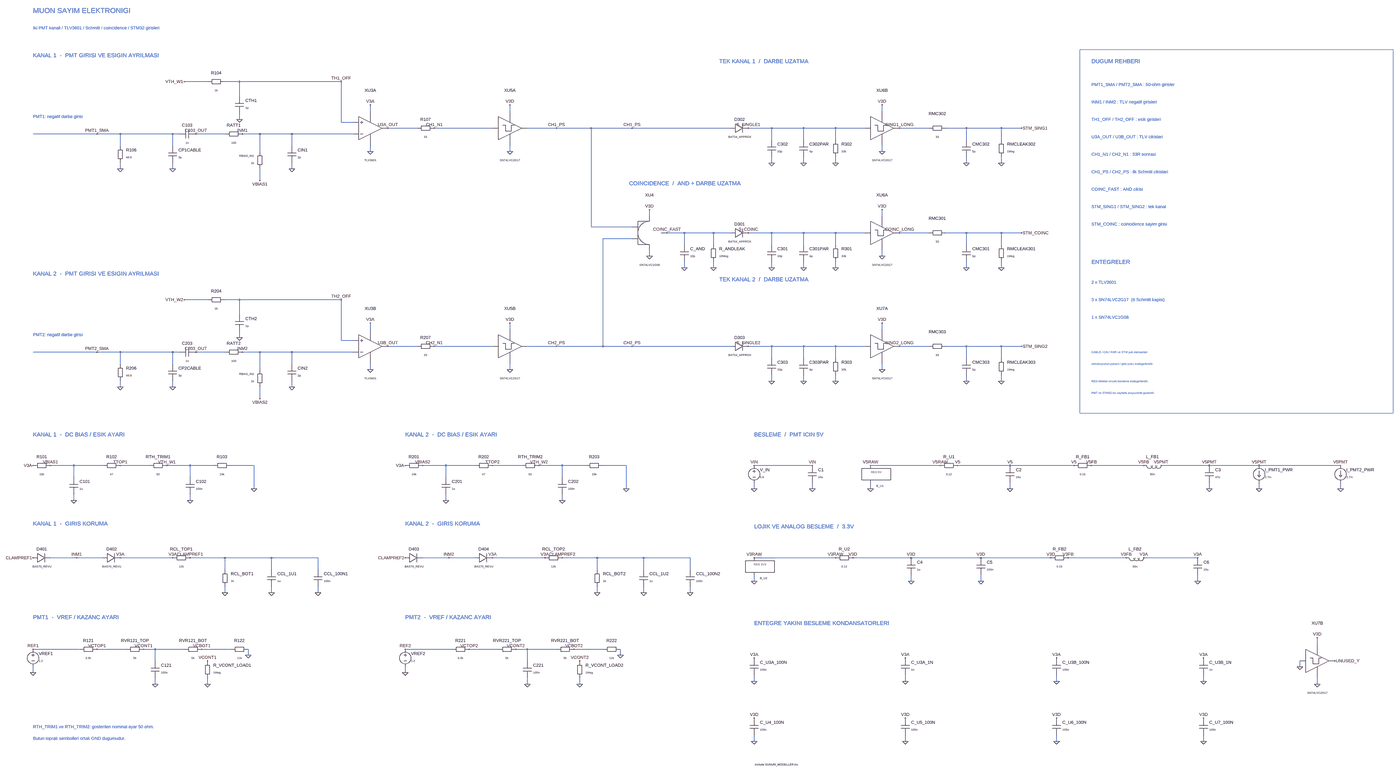
[diagram p0: schematic MUON_SUNUM.asc, whole sheet]
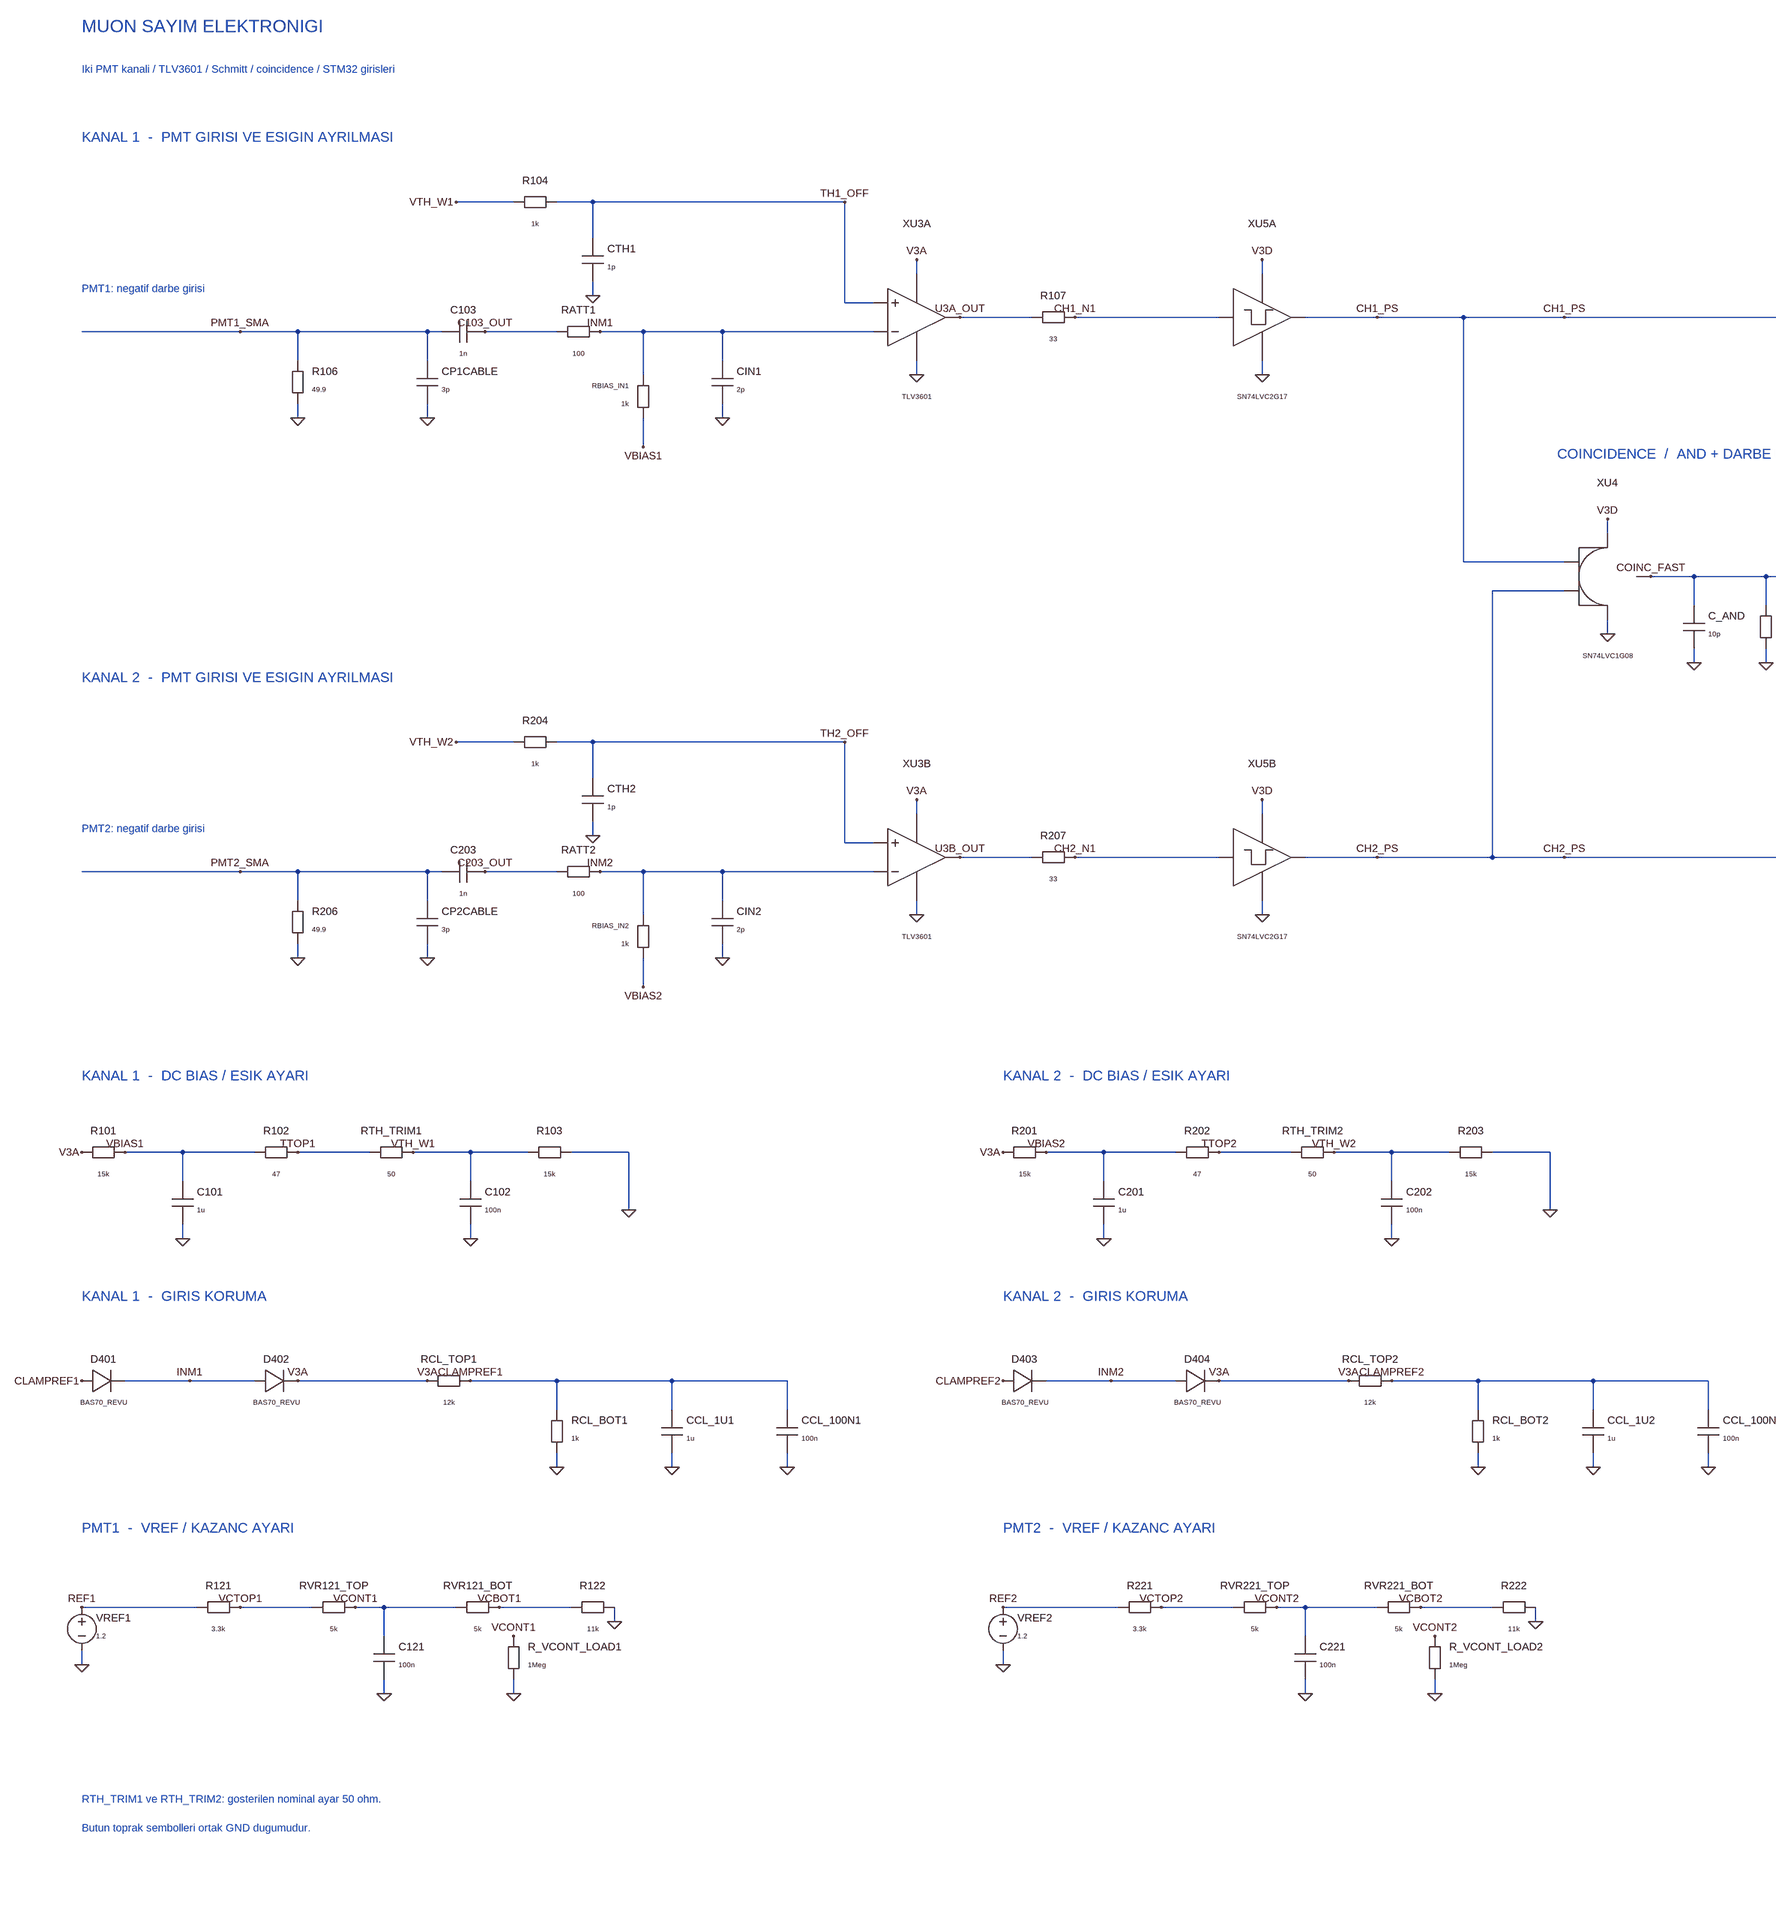
[diagram p1: schematic MUON_SUNUM.asc, part, row 1 of 1, column 1 of 2]
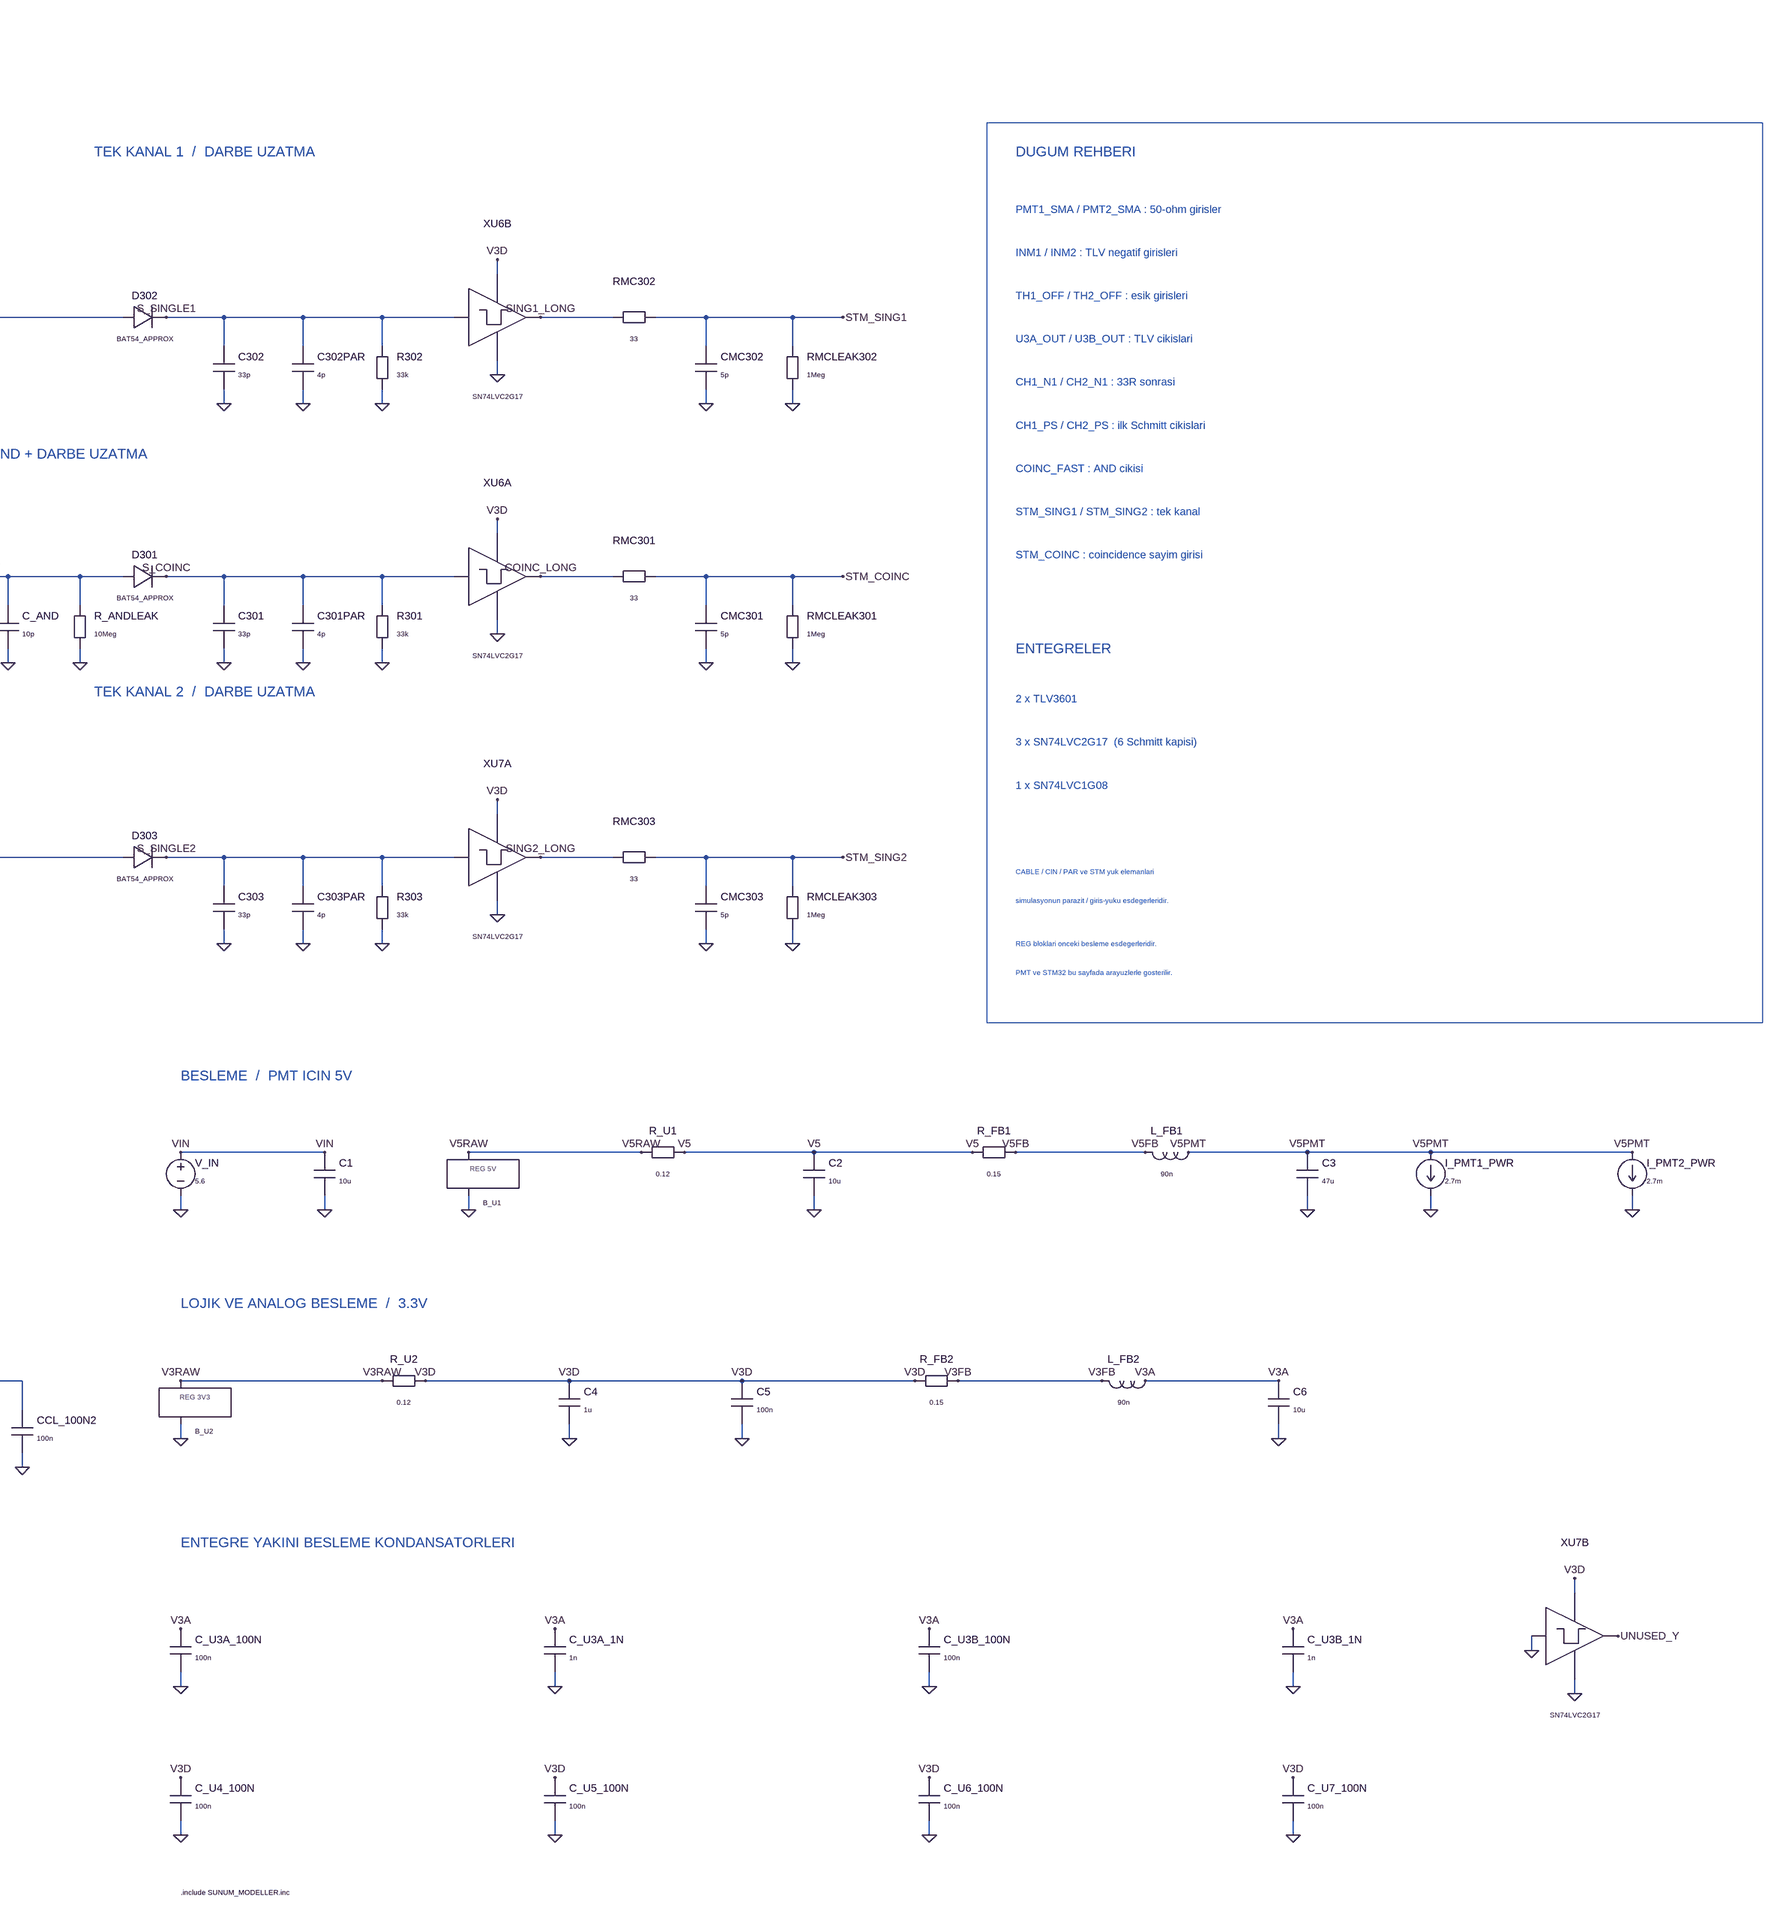
[diagram p2: schematic MUON_SUNUM.asc, part, row 1 of 1, column 2 of 2]
MUON_SUNUM.asc, the LTspice schematic file:
Version 4
SHEET 1 8064 4688
WIRE 1184 512 1376 512
WIRE 1472 512 1600 512
WIRE 1696 512 1824 512
WIRE 1824 512 1824 736
WIRE 1824 736 1888 736
WIRE 1264 688 1264 720
WIRE 1264 512 1264 592
WIRE 608 960 608 992
WIRE 608 800 608 864
WIRE 896 960 896 992
WIRE 896 800 896 864
WIRE 1024 800 1184 800
WIRE 1280 800 1888 800
WIRE 1376 800 1376 896
WIRE 1552 960 1552 992
WIRE 1552 800 1552 864
WIRE 1984 672 1984 640
WIRE 1984 864 1984 896
WIRE 2080 768 2240 768
WIRE 2336 768 2656 768
WIRE 2752 672 2752 640
WIRE 2752 864 2752 896
WIRE 2848 768 3200 768
WIRE 1184 1712 1376 1712
WIRE 1472 1712 1600 1712
WIRE 1696 1712 1824 1712
WIRE 1824 1712 1824 1936
WIRE 1824 1936 1888 1936
WIRE 1264 1888 1264 1920
WIRE 1264 1712 1264 1792
WIRE 608 2160 608 2192
WIRE 608 2000 608 2064
WIRE 896 2160 896 2192
WIRE 896 2000 896 2064
WIRE 1024 2000 1184 2000
WIRE 1280 2000 1888 2000
WIRE 1376 2000 1376 2096
WIRE 1552 2160 1552 2192
WIRE 1552 2000 1552 2064
WIRE 1984 1872 1984 1840
WIRE 1984 2064 1984 2096
WIRE 2080 1968 2240 1968
WIRE 2336 1968 2656 1968
WIRE 2752 1872 2752 1840
WIRE 2752 2064 2752 2096
WIRE 2848 1968 3264 1968
WIRE 3200 768 3200 1312
WIRE 3200 1312 3424 1312
WIRE 3264 1968 3264 1376
WIRE 3264 1376 3424 1376
WIRE 3520 1248 3520 1216
WIRE 3520 1440 3520 1472
WIRE 3616 1344 3968 1344
WIRE 3712 1504 3712 1536
WIRE 3712 1344 3712 1408
WIRE 3872 1504 3872 1536
WIRE 3872 1344 3872 1408
WIRE 4064 1344 4704 1344
WIRE 4192 1504 4192 1536
WIRE 4192 1344 4192 1408
WIRE 4368 1504 4368 1536
WIRE 4368 1344 4368 1408
WIRE 4544 1504 4544 1536
WIRE 4544 1344 4544 1408
WIRE 4800 1248 4800 1216
WIRE 4800 1440 4800 1472
WIRE 4896 1344 5056 1344
WIRE 5152 1344 5568 1344
WIRE 5264 1504 5264 1536
WIRE 5264 1344 5264 1408
WIRE 5456 1504 5456 1536
WIRE 5456 1344 5456 1408
WIRE 3424 768 3968 768
WIRE 4064 768 4704 768
WIRE 4192 928 4192 960
WIRE 4192 768 4192 832
WIRE 4368 928 4368 960
WIRE 4368 768 4368 832
WIRE 4544 928 4544 960
WIRE 4544 768 4544 832
WIRE 4800 672 4800 640
WIRE 4800 864 4800 896
WIRE 4896 768 5056 768
WIRE 5152 768 5568 768
WIRE 5264 928 5264 960
WIRE 5264 768 5264 832
WIRE 5456 928 5456 960
WIRE 5456 768 5456 832
WIRE 3424 1968 3968 1968
WIRE 4064 1968 4704 1968
WIRE 4192 2128 4192 2160
WIRE 4192 1968 4192 2032
WIRE 4368 2128 4368 2160
WIRE 4368 1968 4368 2032
WIRE 4544 2128 4544 2160
WIRE 4544 1968 4544 2032
WIRE 4800 1872 4800 1840
WIRE 4800 2064 4800 2096
WIRE 4896 1968 5056 1968
WIRE 5152 1968 5568 1968
WIRE 5264 2128 5264 2160
WIRE 5264 1968 5264 2032
WIRE 5456 2128 5456 2160
WIRE 5456 1968 5456 2032
WIRE 224 2672 512 2672
WIRE 608 2672 768 2672
WIRE 864 2672 1120 2672
WIRE 1216 2672 1344 2672
WIRE 1344 2768 1344 2800
WIRE 352 2832 352 2864
WIRE 352 2672 352 2736
WIRE 992 2832 992 2864
WIRE 992 2672 992 2736
WIRE 2272 2672 2560 2672
WIRE 2656 2672 2816 2672
WIRE 2912 2672 3168 2672
WIRE 3264 2672 3392 2672
WIRE 3392 2768 3392 2800
WIRE 2400 2832 2400 2864
WIRE 2400 2672 2400 2736
WIRE 3040 2832 3040 2864
WIRE 3040 2672 3040 2736
WIRE 1184 3360 1184 3392
WIRE 1440 3360 1440 3392
WIRE 1696 3360 1696 3392
WIRE 992 3200 1696 3200
WIRE 1184 3200 1184 3264
WIRE 1440 3200 1440 3264
WIRE 1696 3200 1696 3264
WIRE 3232 3360 3232 3392
WIRE 3488 3360 3488 3392
WIRE 3744 3360 3744 3392
WIRE 3040 3200 3744 3200
WIRE 3232 3200 3232 3264
WIRE 3488 3200 3488 3264
WIRE 3744 3200 3744 3264
WIRE 128 3904 128 3936
WIRE 128 3808 384 3808
WIRE 480 3808 640 3808
WIRE 736 3808 960 3808
WIRE 1056 3808 1216 3808
WIRE 1312 3808 1312 3840
WIRE 800 3968 800 4000
WIRE 800 3808 800 3872
WIRE 1088 3968 1088 4000
WIRE 2176 3904 2176 3936
WIRE 2176 3808 2432 3808
WIRE 2528 3808 2688 3808
WIRE 2784 3808 3008 3808
WIRE 3104 3808 3264 3808
WIRE 3360 3808 3360 3840
WIRE 2848 3968 2848 4000
WIRE 2848 3808 2848 3872
WIRE 3136 3968 3136 4000
WIRE 4096 2768 4096 2800
WIRE 4416 2768 4416 2800
WIRE 4736 2768 4736 2800
WIRE 5504 2768 5504 2800
WIRE 6624 2768 6624 2800
WIRE 7008 2768 7008 2800
WIRE 7456 2768 7456 2800
WIRE 4096 3296 4096 3328
WIRE 4960 3296 4960 3328
WIRE 5344 3296 5344 3328
WIRE 6560 3296 6560 3328
WIRE 4096 3952 4096 3984
WIRE 4928 3952 4928 3984
WIRE 5760 3952 5760 3984
WIRE 6592 3952 6592 3984
WIRE 4096 4304 4096 4336
WIRE 4928 4304 4928 4336
WIRE 5760 4304 5760 4336
WIRE 6592 4304 6592 4336
WIRE 7232 3872 7232 3904
WIRE 7328 3776 7328 3744
WIRE 7328 3968 7328 4000
WIRE 1472 1712 1376 1712
WIRE 1472 512 1376 512
WIRE 3392 2672 3392 2768
WIRE 1600 1712 1696 1712
WIRE 1600 512 1696 512
WIRE 1344 2672 1344 2768
WIRE 128 800 928 800
WIRE 128 2000 928 2000
WIRE 3200 768 3424 768
WIRE 3264 1968 3424 1968
WIRE 1376 992 1376 1056
WIRE 1376 2192 1376 2256
WIRE 960 512 1088 512
WIRE 960 1712 1088 1712
WIRE 224 3200 512 3200
WIRE 608 3200 896 3200
WIRE 2272 3200 2560 3200
WIRE 2656 3200 2944 3200
WIRE 4096 2672 4416 2672
WIRE 4736 2672 5120 2672
WIRE 5216 2672 5504 2672
WIRE 5504 2672 5856 2672
WIRE 5952 2672 6240 2672
WIRE 6336 2672 6624 2672
WIRE 6624 2672 7008 2672
WIRE 7008 2672 7456 2672
WIRE 4096 3200 4544 3200
WIRE 4640 3200 4960 3200
WIRE 4960 3200 5344 3200
WIRE 5344 3200 5728 3200
WIRE 5824 3200 6144 3200
WIRE 6240 3200 6560 3200
FLAG 1264 720 0
FLAG 480 800 PMT1_SMA
FLAG 608 992 0
FLAG 896 992 0
FLAG 1024 800 C103_OUT
FLAG 1280 800 INM1
FLAG 1552 992 0
FLAG 1984 640 V3A
FLAG 1984 896 0
FLAG 2080 768 U3A_OUT
FLAG 2336 768 CH1_N1
FLAG 3008 768 CH1_PS
FLAG 2752 640 V3D
FLAG 2752 896 0
FLAG 1264 1920 0
FLAG 480 2000 PMT2_SMA
FLAG 608 2192 0
FLAG 896 2192 0
FLAG 1024 2000 C203_OUT
FLAG 1280 2000 INM2
FLAG 1552 2192 0
FLAG 1984 1840 V3A
FLAG 1984 2096 0
FLAG 2080 1968 U3B_OUT
FLAG 2336 1968 CH2_N1
FLAG 3008 1968 CH2_PS
FLAG 2752 1840 V3D
FLAG 2752 2096 0
FLAG 3616 1344 COINC_FAST
FLAG 3520 1216 V3D
FLAG 3520 1472 0
FLAG 3712 1536 0
FLAG 3872 1536 0
FLAG 4064 1344 S_COINC
FLAG 4192 1536 0
FLAG 4368 1536 0
FLAG 4544 1536 0
FLAG 4896 1344 COINC_LONG
FLAG 4800 1216 V3D
FLAG 4800 1472 0
FLAG 5568 1344 STM_COINC
FLAG 5264 1536 0
FLAG 5456 1536 0
FLAG 3424 768 CH1_PS
FLAG 4064 768 S_SINGLE1
FLAG 4192 960 0
FLAG 4368 960 0
FLAG 4544 960 0
FLAG 4896 768 SING1_LONG
FLAG 4800 640 V3D
FLAG 4800 896 0
FLAG 5568 768 STM_SING1
FLAG 5264 960 0
FLAG 5456 960 0
FLAG 3424 1968 CH2_PS
FLAG 4064 1968 S_SINGLE2
FLAG 4192 2160 0
FLAG 4368 2160 0
FLAG 4544 2160 0
FLAG 4896 1968 SING2_LONG
FLAG 4800 1840 V3D
FLAG 4800 2096 0
FLAG 5568 1968 STM_SING2
FLAG 5264 2160 0
FLAG 5456 2160 0
FLAG 128 2672 V3A
FLAG 224 2672 VBIAS1
FLAG 608 2672 TTOP1
FLAG 864 2672 VTH_W1
FLAG 1344 2800 0
FLAG 352 2864 0
FLAG 992 2864 0
FLAG 2176 2672 V3A
FLAG 2272 2672 VBIAS2
FLAG 2656 2672 TTOP2
FLAG 2912 2672 VTH_W2
FLAG 3392 2800 0
FLAG 2400 2864 0
FLAG 3040 2864 0
FLAG 128 3200 CLAMPREF1
FLAG 608 3200 V3A
FLAG 896 3200 V3A
FLAG 992 3200 CLAMPREF1
FLAG 1184 3392 0
FLAG 1440 3392 0
FLAG 1696 3392 0
FLAG 2176 3200 CLAMPREF2
FLAG 2656 3200 V3A
FLAG 2944 3200 V3A
FLAG 3040 3200 CLAMPREF2
FLAG 3232 3392 0
FLAG 3488 3392 0
FLAG 3744 3392 0
FLAG 128 3808 REF1
FLAG 128 3936 0
FLAG 480 3808 VCTOP1
FLAG 736 3808 VCONT1
FLAG 1056 3808 VCBOT1
FLAG 1312 3840 0
FLAG 800 4000 0
FLAG 1088 3872 VCONT1
FLAG 1088 4000 0
FLAG 2176 3808 REF2
FLAG 2176 3936 0
FLAG 2528 3808 VCTOP2
FLAG 2784 3808 VCONT2
FLAG 3104 3808 VCBOT2
FLAG 3360 3840 0
FLAG 2848 4000 0
FLAG 3136 3872 VCONT2
FLAG 3136 4000 0
FLAG 4096 2672 VIN
FLAG 4096 2800 0
FLAG 4416 2672 VIN
FLAG 4416 2800 0
FLAG 4736 2672 V5RAW
FLAG 4736 2800 0
FLAG 5120 2672 V5RAW
FLAG 5216 2672 V5
FLAG 5504 2672 V5
FLAG 5504 2800 0
FLAG 5856 2672 V5
FLAG 5952 2672 V5FB
FLAG 6240 2672 V5FB
FLAG 6336 2672 V5PMT
FLAG 6624 2672 V5PMT
FLAG 6624 2800 0
FLAG 7008 2672 V5PMT
FLAG 7008 2800 0
FLAG 7456 2672 V5PMT
FLAG 7456 2800 0
FLAG 4096 3200 V3RAW
FLAG 4096 3328 0
FLAG 4544 3200 V3RAW
FLAG 4640 3200 V3D
FLAG 4960 3200 V3D
FLAG 4960 3328 0
FLAG 5344 3200 V3D
FLAG 5344 3328 0
FLAG 5728 3200 V3D
FLAG 5824 3200 V3FB
FLAG 6144 3200 V3FB
FLAG 6240 3200 V3A
FLAG 6560 3200 V3A
FLAG 6560 3328 0
FLAG 4096 3856 V3A
FLAG 4096 3984 0
FLAG 4928 3856 V3A
FLAG 4928 3984 0
FLAG 5760 3856 V3A
FLAG 5760 3984 0
FLAG 6592 3856 V3A
FLAG 6592 3984 0
FLAG 4096 4208 V3D
FLAG 4096 4336 0
FLAG 4928 4208 V3D
FLAG 4928 4336 0
FLAG 5760 4208 V3D
FLAG 5760 4336 0
FLAG 6592 4208 V3D
FLAG 6592 4336 0
FLAG 7424 3872 UNUSED_Y
FLAG 7232 3904 0
FLAG 7328 3744 V3D
FLAG 7328 4000 0
FLAG 1824 512 TH1_OFF
FLAG 1824 1712 TH2_OFF
FLAG 1376 1056 VBIAS1
FLAG 1376 2256 VBIAS2
FLAG 960 512 VTH_W1
FLAG 960 1712 VTH_W2
FLAG 368 3200 INM1
FLAG 2416 3200 INM2
SYMBOL AJ_RH 1088 512 R0
SYMATTR InstName R104
SYMATTR Value 1k
SYMBOL AJ_CV 1264 592 R0
SYMATTR InstName CTH1
SYMATTR Value 1p
SYMBOL AJ_RV 608 864 R0
SYMATTR InstName R106
SYMATTR Value 49.9
SYMBOL AJ_CV 896 864 R0
SYMATTR InstName CP1CABLE
SYMATTR Value 3p
SYMBOL AJ_CH 928 800 R0
SYMATTR InstName C103
SYMATTR Value 1n
SYMBOL AJ_RH 1184 800 R0
SYMATTR InstName RATT1
SYMATTR Value 100
SYMBOL SUN_RBIAS_V 1376 896 R0
SYMATTR InstName RBIAS_IN1
SYMATTR Value 1k
SYMBOL AJ_CV 1552 864 R0
SYMATTR InstName CIN1
SYMATTR Value 2p
SYMBOL AJ_TLV3601 1888 704 R0
SYMATTR InstName XU3A
SYMATTR Value TLV3601
SYMBOL AJ_RH 2240 768 R0
SYMATTR InstName R107
SYMATTR Value 33
SYMBOL AJ_SCHMITT 2656 704 R0
SYMATTR InstName XU5A
SYMATTR Value SN74LVC2G17
SYMBOL AJ_RH 1088 1712 R0
SYMATTR InstName R204
SYMATTR Value 1k
SYMBOL AJ_CV 1264 1792 R0
SYMATTR InstName CTH2
SYMATTR Value 1p
SYMBOL AJ_RV 608 2064 R0
SYMATTR InstName R206
SYMATTR Value 49.9
SYMBOL AJ_CV 896 2064 R0
SYMATTR InstName CP2CABLE
SYMATTR Value 3p
SYMBOL AJ_CH 928 2000 R0
SYMATTR InstName C203
SYMATTR Value 1n
SYMBOL AJ_RH 1184 2000 R0
SYMATTR InstName RATT2
SYMATTR Value 100
SYMBOL SUN_RBIAS_V 1376 2096 R0
SYMATTR InstName RBIAS_IN2
SYMATTR Value 1k
SYMBOL AJ_CV 1552 2064 R0
SYMATTR InstName CIN2
SYMATTR Value 2p
SYMBOL AJ_TLV3601 1888 1904 R0
SYMATTR InstName XU3B
SYMATTR Value TLV3601
SYMBOL AJ_RH 2240 1968 R0
SYMATTR InstName R207
SYMATTR Value 33
SYMBOL AJ_SCHMITT 2656 1904 R0
SYMATTR InstName XU5B
SYMATTR Value SN74LVC2G17
SYMBOL AJ_AND 3424 1280 R0
SYMATTR InstName XU4
SYMATTR Value SN74LVC1G08
SYMBOL AJ_CV 3712 1408 R0
SYMATTR InstName C_AND
SYMATTR Value 10p
SYMBOL AJ_RV 3872 1408 R0
SYMATTR InstName R_ANDLEAK
SYMATTR Value 10Meg
SYMBOL AJ_DH 3968 1344 R0
SYMATTR InstName D301
SYMATTR Value BAT54_APPROX
SYMBOL AJ_CV 4192 1408 R0
SYMATTR InstName C301
SYMATTR Value 33p
SYMBOL AJ_CV 4368 1408 R0
SYMATTR InstName C301PAR
SYMATTR Value 4p
SYMBOL AJ_RV 4544 1408 R0
SYMATTR InstName R301
SYMATTR Value 33k
SYMBOL AJ_SCHMITT 4704 1280 R0
SYMATTR InstName XU6A
SYMATTR Value SN74LVC2G17
SYMBOL SUN_RMC_H 5056 1344 R0
SYMATTR InstName RMC301
SYMATTR Value 33
SYMBOL AJ_CV 5264 1408 R0
SYMATTR InstName CMC301
SYMATTR Value 5p
SYMBOL AJ_RV 5456 1408 R0
SYMATTR InstName RMCLEAK301
SYMATTR Value 1Meg
SYMBOL AJ_DH 3968 768 R0
SYMATTR InstName D302
SYMATTR Value BAT54_APPROX
SYMBOL AJ_CV 4192 832 R0
SYMATTR InstName C302
SYMATTR Value 33p
SYMBOL AJ_CV 4368 832 R0
SYMATTR InstName C302PAR
SYMATTR Value 4p
SYMBOL AJ_RV 4544 832 R0
SYMATTR InstName R302
SYMATTR Value 33k
SYMBOL AJ_SCHMITT 4704 704 R0
SYMATTR InstName XU6B
SYMATTR Value SN74LVC2G17
SYMBOL SUN_RMC_H 5056 768 R0
SYMATTR InstName RMC302
SYMATTR Value 33
SYMBOL AJ_CV 5264 832 R0
SYMATTR InstName CMC302
SYMATTR Value 5p
SYMBOL AJ_RV 5456 832 R0
SYMATTR InstName RMCLEAK302
SYMATTR Value 1Meg
SYMBOL AJ_DH 3968 1968 R0
SYMATTR InstName D303
SYMATTR Value BAT54_APPROX
SYMBOL AJ_CV 4192 2032 R0
SYMATTR InstName C303
SYMATTR Value 33p
SYMBOL AJ_CV 4368 2032 R0
SYMATTR InstName C303PAR
SYMATTR Value 4p
SYMBOL AJ_RV 4544 2032 R0
SYMATTR InstName R303
SYMATTR Value 33k
SYMBOL AJ_SCHMITT 4704 1904 R0
SYMATTR InstName XU7A
SYMATTR Value SN74LVC2G17
SYMBOL SUN_RMC_H 5056 1968 R0
SYMATTR InstName RMC303
SYMATTR Value 33
SYMBOL AJ_CV 5264 2032 R0
SYMATTR InstName CMC303
SYMATTR Value 5p
SYMBOL AJ_RV 5456 2032 R0
SYMATTR InstName RMCLEAK303
SYMATTR Value 1Meg
SYMBOL AJ_RH 128 2672 R0
SYMATTR InstName R101
SYMATTR Value 15k
SYMBOL AJ_RH 512 2672 R0
SYMATTR InstName R102
SYMATTR Value 47
SYMBOL AJ_RH 768 2672 R0
SYMATTR InstName RTH_TRIM1
SYMATTR Value 50
SYMBOL AJ_RH 1120 2672 R0
SYMATTR InstName R103
SYMATTR Value 15k
SYMBOL AJ_CV 352 2736 R0
SYMATTR InstName C101
SYMATTR Value 1u
SYMBOL AJ_CV 992 2736 R0
SYMATTR InstName C102
SYMATTR Value 100n
SYMBOL AJ_RH 2176 2672 R0
SYMATTR InstName R201
SYMATTR Value 15k
SYMBOL AJ_RH 2560 2672 R0
SYMATTR InstName R202
SYMATTR Value 47
SYMBOL AJ_RH 2816 2672 R0
SYMATTR InstName RTH_TRIM2
SYMATTR Value 50
SYMBOL AJ_RH 3168 2672 R0
SYMATTR InstName R203
SYMATTR Value 15k
SYMBOL AJ_CV 2400 2736 R0
SYMATTR InstName C201
SYMATTR Value 1u
SYMBOL AJ_CV 3040 2736 R0
SYMATTR InstName C202
SYMATTR Value 100n
SYMBOL AJ_DH 128 3200 R0
SYMATTR InstName D401
SYMATTR Value BAS70_REVU
SYMBOL AJ_DH 512 3200 R0
SYMATTR InstName D402
SYMATTR Value BAS70_REVU
SYMBOL AJ_RH 896 3200 R0
SYMATTR InstName RCL_TOP1
SYMATTR Value 12k
SYMBOL AJ_RV 1184 3264 R0
SYMATTR InstName RCL_BOT1
SYMATTR Value 1k
SYMBOL AJ_CV 1440 3264 R0
SYMATTR InstName CCL_1U1
SYMATTR Value 1u
SYMBOL AJ_CV 1696 3264 R0
SYMATTR InstName CCL_100N1
SYMATTR Value 100n
SYMBOL AJ_DH 2176 3200 R0
SYMATTR InstName D403
SYMATTR Value BAS70_REVU
SYMBOL AJ_DH 2560 3200 R0
SYMATTR InstName D404
SYMATTR Value BAS70_REVU
SYMBOL AJ_RH 2944 3200 R0
SYMATTR InstName RCL_TOP2
SYMATTR Value 12k
SYMBOL AJ_RV 3232 3264 R0
SYMATTR InstName RCL_BOT2
SYMATTR Value 1k
SYMBOL AJ_CV 3488 3264 R0
SYMATTR InstName CCL_1U2
SYMATTR Value 1u
SYMBOL AJ_CV 3744 3264 R0
SYMATTR InstName CCL_100N2
SYMATTR Value 100n
SYMBOL AJ_VV 128 3808 R0
SYMATTR InstName VREF1
SYMATTR Value 1.2
SYMBOL AJ_RH 384 3808 R0
SYMATTR InstName R121
SYMATTR Value 3.3k
SYMBOL AJ_RH 640 3808 R0
SYMATTR InstName RVR121_TOP
SYMATTR Value 5k
SYMBOL AJ_RH 960 3808 R0
SYMATTR InstName RVR121_BOT
SYMATTR Value 5k
SYMBOL AJ_RH 1216 3808 R0
SYMATTR InstName R122
SYMATTR Value 11k
SYMBOL AJ_CV 800 3872 R0
SYMATTR InstName C121
SYMATTR Value 100n
SYMBOL AJ_RV 1088 3872 R0
SYMATTR InstName R_VCONT_LOAD1
SYMATTR Value 1Meg
SYMBOL AJ_VV 2176 3808 R0
SYMATTR InstName VREF2
SYMATTR Value 1.2
SYMBOL AJ_RH 2432 3808 R0
SYMATTR InstName R221
SYMATTR Value 3.3k
SYMBOL AJ_RH 2688 3808 R0
SYMATTR InstName RVR221_TOP
SYMATTR Value 5k
SYMBOL AJ_RH 3008 3808 R0
SYMATTR InstName RVR221_BOT
SYMATTR Value 5k
SYMBOL AJ_RH 3264 3808 R0
SYMATTR InstName R222
SYMATTR Value 11k
SYMBOL AJ_CV 2848 3872 R0
SYMATTR InstName C221
SYMATTR Value 100n
SYMBOL AJ_RV 3136 3872 R0
SYMATTR InstName R_VCONT_LOAD2
SYMATTR Value 1Meg
SYMBOL AJ_VV 4096 2672 R0
SYMATTR InstName V_IN
SYMATTR Value 5.6
SYMBOL AJ_CV 4416 2672 R0
SYMATTR InstName C1
SYMATTR Value 10u
SYMBOL SUN_REG5 4736 2672 R0
SYMATTR InstName B_U1
SYMATTR Value V={min(5,max(0,V(VIN)-0.35))}
SYMBOL AJ_RH 5120 2672 R0
SYMATTR InstName R_U1
SYMATTR Value 0.12
SYMBOL AJ_CV 5504 2672 R0
SYMATTR InstName C2
SYMATTR Value 10u
SYMBOL AJ_RH 5856 2672 R0
SYMATTR InstName R_FB1
SYMATTR Value 0.15
SYMBOL AJ_LH 6240 2672 R0
SYMATTR InstName L_FB1
SYMATTR Value 90n
SYMBOL AJ_CV 6624 2672 R0
SYMATTR InstName C3
SYMATTR Value 47u
SYMBOL AJ_IV 7008 2672 R0
SYMATTR InstName I_PMT1_PWR
SYMATTR Value 2.7m
SYMBOL AJ_IV 7456 2672 R0
SYMATTR InstName I_PMT2_PWR
SYMATTR Value 2.7m
SYMBOL SUN_REG33 4096 3200 R0
SYMATTR InstName B_U2
SYMATTR Value V={min(3.3,max(0,V(V5)-0.35))}
SYMBOL AJ_RH 4544 3200 R0
SYMATTR InstName R_U2
SYMATTR Value 0.12
SYMBOL AJ_CV 4960 3200 R0
SYMATTR InstName C4
SYMATTR Value 1u
SYMBOL AJ_CV 5344 3200 R0
SYMATTR InstName C5
SYMATTR Value 100n
SYMBOL AJ_RH 5728 3200 R0
SYMATTR InstName R_FB2
SYMATTR Value 0.15
SYMBOL AJ_LH 6144 3200 R0
SYMATTR InstName L_FB2
SYMATTR Value 90n
SYMBOL AJ_CV 6560 3200 R0
SYMATTR InstName C6
SYMATTR Value 10u
SYMBOL AJ_CV 4096 3856 R0
SYMATTR InstName C_U3A_100N
SYMATTR Value 100n
SYMBOL AJ_CV 4928 3856 R0
SYMATTR InstName C_U3A_1N
SYMATTR Value 1n
SYMBOL AJ_CV 5760 3856 R0
SYMATTR InstName C_U3B_100N
SYMATTR Value 100n
SYMBOL AJ_CV 6592 3856 R0
SYMATTR InstName C_U3B_1N
SYMATTR Value 1n
SYMBOL AJ_CV 4096 4208 R0
SYMATTR InstName C_U4_100N
SYMATTR Value 100n
SYMBOL AJ_CV 4928 4208 R0
SYMATTR InstName C_U5_100N
SYMATTR Value 100n
SYMBOL AJ_CV 5760 4208 R0
SYMATTR InstName C_U6_100N
SYMATTR Value 100n
SYMBOL AJ_CV 6592 4208 R0
SYMATTR InstName C_U7_100N
SYMATTR Value 100n
SYMBOL AJ_SCHMITT 7232 3808 R0
SYMATTR InstName XU7B
SYMATTR Value SN74LVC2G17
RECTANGLE Normal 5888 336 7904 2336
TEXT 128 96 Left 4 ;MUON SAYIM ELEKTRONIGI
TEXT 128 192 Left 2 ;Iki PMT kanali / TLV3601 / Schmitt / coincidence / STM32 girisleri
TEXT 128 368 Left 3 ;KANAL 1  -  PMT GIRISI VE ESIGIN AYRILMASI
TEXT 128 704 Left 2 ;PMT1: negatif darbe girisi
TEXT 128 1568 Left 3 ;KANAL 2  -  PMT GIRISI VE ESIGIN AYRILMASI
TEXT 128 1904 Left 2 ;PMT2: negatif darbe girisi
TEXT 3904 400 Left 3 ;TEK KANAL 1  /  DARBE UZATMA
TEXT 3408 1072 Left 3 ;COINCIDENCE  /  AND + DARBE UZATMA
TEXT 3904 1600 Left 3 ;TEK KANAL 2  /  DARBE UZATMA
TEXT 128 2480 Left 3 ;KANAL 1  -  DC BIAS / ESIK AYARI
TEXT 2176 2480 Left 3 ;KANAL 2  -  DC BIAS / ESIK AYARI
TEXT 128 2992 Left 3 ;KANAL 1  -  GIRIS KORUMA
TEXT 2176 2992 Left 3 ;KANAL 2  -  GIRIS KORUMA
TEXT 128 3632 Left 3 ;PMT1  -  VREF / KAZANC AYARI
TEXT 2176 3632 Left 3 ;PMT2  -  VREF / KAZANC AYARI
TEXT 4096 2480 Left 3 ;BESLEME  /  PMT ICIN 5V
TEXT 4096 3008 Left 3 ;LOJIK VE ANALOG BESLEME  /  3.3V
TEXT 4096 3664 Left 3 ;ENTEGRE YAKINI BESLEME KONDANSATORLERI
TEXT 128 4256 Left 2 ;RTH_TRIM1 ve RTH_TRIM2: gosterilen nominal ayar 50 ohm.
TEXT 128 4320 Left 2 ;Butun toprak sembolleri ortak GND dugumudur.
TEXT 4096 4528 Left 1 !.include SUNUM_MODELLER.inc
TEXT 5952 400 Left 3 ;DUGUM REHBERI
TEXT 5952 528 Left 2 ;PMT1_SMA / PMT2_SMA : 50-ohm girisler
TEXT 5952 624 Left 2 ;INM1 / INM2 : TLV negatif girisleri
TEXT 5952 720 Left 2 ;TH1_OFF / TH2_OFF : esik girisleri
TEXT 5952 816 Left 2 ;U3A_OUT / U3B_OUT : TLV cikislari
TEXT 5952 912 Left 2 ;CH1_N1 / CH2_N1 : 33R sonrasi
TEXT 5952 1008 Left 2 ;CH1_PS / CH2_PS : ilk Schmitt cikislari
TEXT 5952 1104 Left 2 ;COINC_FAST : AND cikisi
TEXT 5952 1200 Left 2 ;STM_SING1 / STM_SING2 : tek kanal
TEXT 5952 1296 Left 2 ;STM_COINC : coincidence sayim girisi
TEXT 5952 1504 Left 3 ;ENTEGRELER
TEXT 5952 1616 Left 2 ;2 x TLV3601
TEXT 5952 1712 Left 2 ;3 x SN74LVC2G17  (6 Schmitt kapisi)
TEXT 5952 1808 Left 2 ;1 x SN74LVC1G08
TEXT 5952 2000 Left 1 ;CABLE / CIN / PAR ve STM yuk elemanlari
TEXT 5952 2064 Left 1 ;simulasyonun parazit / giris-yuku esdegerleridir.
TEXT 5952 2160 Left 1 ;REG bloklari onceki besleme esdegerleridir.
TEXT 5952 2224 Left 1 ;PMT ve STM32 bu sayfada arayuzlerle gosterilir.

The netlist it stands for:
* MUON_SUNUM.asc
R104 VTH_W1 TH1_OFF 1k
CTH1 TH1_OFF 0 1p
R106 PMT1_SMA 0 49.9
CP1CABLE PMT1_SMA 0 3p
C103 PMT1_SMA C103_OUT 1n
RATT1 C103_OUT INM1 100
RBIAS_IN1 INM1 VBIAS1 1k
CIN1 INM1 0 2p
XXU3A TH1_OFF INM1 V3A 0 U3A_OUT TLV3601  ; pins IN+_[3] IN-_[4] VCC_[5] GND_[2] OUT_[1]
R107 U3A_OUT CH1_N1 33
XXU5A CH1_PS CH1_N1 V3D 0 SN74LVC2G17  ; pins Y A VCC GND
R204 VTH_W2 TH2_OFF 1k
CTH2 TH2_OFF 0 1p
R206 PMT2_SMA 0 49.9
CP2CABLE PMT2_SMA 0 3p
C203 PMT2_SMA C203_OUT 1n
RATT2 C203_OUT INM2 100
RBIAS_IN2 INM2 VBIAS2 1k
CIN2 INM2 0 2p
XXU3B TH2_OFF INM2 V3A 0 U3B_OUT TLV3601  ; pins IN+_[3] IN-_[4] VCC_[5] GND_[2] OUT_[1]
R207 U3B_OUT CH2_N1 33
XXU5B CH2_PS CH2_N1 V3D 0 SN74LVC2G17  ; pins Y A VCC GND
XXU4 COINC_FAST CH1_PS CH2_PS V3D 0 SN74LVC1G08  ; pins Y_[4] A_[1] B_[2] VCC_[5] GND_[3]
C_AND COINC_FAST 0 10p
R_ANDLEAK COINC_FAST 0 10Meg
D301 COINC_FAST S_COINC BAT54_APPROX
C301 S_COINC 0 33p
C301PAR S_COINC 0 4p
R301 S_COINC 0 33k
XXU6A COINC_LONG S_COINC V3D 0 SN74LVC2G17  ; pins Y A VCC GND
RMC301 COINC_LONG STM_COINC 33
CMC301 STM_COINC 0 5p
RMCLEAK301 STM_COINC 0 1Meg
D302 CH1_PS S_SINGLE1 BAT54_APPROX
C302 S_SINGLE1 0 33p
C302PAR S_SINGLE1 0 4p
R302 S_SINGLE1 0 33k
XXU6B SING1_LONG S_SINGLE1 V3D 0 SN74LVC2G17  ; pins Y A VCC GND
RMC302 SING1_LONG STM_SING1 33
CMC302 STM_SING1 0 5p
RMCLEAK302 STM_SING1 0 1Meg
D303 CH2_PS S_SINGLE2 BAT54_APPROX
C303 S_SINGLE2 0 33p
C303PAR S_SINGLE2 0 4p
R303 S_SINGLE2 0 33k
XXU7A SING2_LONG S_SINGLE2 V3D 0 SN74LVC2G17  ; pins Y A VCC GND
RMC303 SING2_LONG STM_SING2 33
CMC303 STM_SING2 0 5p
RMCLEAK303 STM_SING2 0 1Meg
R101 V3A VBIAS1 15k
R102 VBIAS1 TTOP1 47
RTH_TRIM1 TTOP1 VTH_W1 50
R103 VTH_W1 0 15k
C101 VBIAS1 0 1u
C102 VTH_W1 0 100n
R201 V3A VBIAS2 15k
R202 VBIAS2 TTOP2 47
RTH_TRIM2 TTOP2 VTH_W2 50
R203 VTH_W2 0 15k
C201 VBIAS2 0 1u
C202 VTH_W2 0 100n
D401 CLAMPREF1 INM1 BAS70_REVU
D402 INM1 V3A BAS70_REVU
RCL_TOP1 V3A CLAMPREF1 12k
RCL_BOT1 CLAMPREF1 0 1k
CCL_1U1 CLAMPREF1 0 1u
CCL_100N1 CLAMPREF1 0 100n
D403 CLAMPREF2 INM2 BAS70_REVU
D404 INM2 V3A BAS70_REVU
RCL_TOP2 V3A CLAMPREF2 12k
RCL_BOT2 CLAMPREF2 0 1k
CCL_1U2 CLAMPREF2 0 1u
CCL_100N2 CLAMPREF2 0 100n
VREF1 REF1 0 1.2
R121 REF1 VCTOP1 3.3k
RVR121_TOP VCTOP1 VCONT1 5k
RVR121_BOT VCONT1 VCBOT1 5k
R122 VCBOT1 0 11k
C121 VCONT1 0 100n
R_VCONT_LOAD1 VCONT1 0 1Meg
VREF2 REF2 0 1.2
R221 REF2 VCTOP2 3.3k
RVR221_TOP VCTOP2 VCONT2 5k
RVR221_BOT VCONT2 VCBOT2 5k
R222 VCBOT2 0 11k
C221 VCONT2 0 100n
R_VCONT_LOAD2 VCONT2 0 1Meg
V_IN VIN 0 5.6
C1 VIN 0 10u
B_U1 V5RAW 0 V={min(5,max(0,V(VIN)-0.35))}
R_U1 V5RAW V5 0.12
C2 V5 0 10u
R_FB1 V5 V5FB 0.15
L_FB1 V5FB V5PMT 90n
C3 V5PMT 0 47u
I_PMT1_PWR V5PMT 0 2.7m
I_PMT2_PWR V5PMT 0 2.7m
B_U2 V3RAW 0 V={min(3.3,max(0,V(V5)-0.35))}
R_U2 V3RAW V3D 0.12
C4 V3D 0 1u
C5 V3D 0 100n
R_FB2 V3D V3FB 0.15
L_FB2 V3FB V3A 90n
C6 V3A 0 10u
C_U3A_100N V3A 0 100n
C_U3A_1N V3A 0 1n
C_U3B_100N V3A 0 100n
C_U3B_1N V3A 0 1n
C_U4_100N V3D 0 100n
C_U5_100N V3D 0 100n
C_U6_100N V3D 0 100n
C_U7_100N V3D 0 100n
XXU7B UNUSED_Y 0 V3D 0 SN74LVC2G17  ; pins Y A VCC GND
.model D D
.lib standard.dio
* MUON SAYIM ELEKTRONIGI
* Iki PMT kanali / TLV3601 / Schmitt / coincidence / STM32 girisleri
* KANAL 1  -  PMT GIRISI VE ESIGIN AYRILMASI
* PMT1: negatif darbe girisi
* KANAL 2  -  PMT GIRISI VE ESIGIN AYRILMASI
* PMT2: negatif darbe girisi
* TEK KANAL 1  /  DARBE UZATMA
* COINCIDENCE  /  AND + DARBE UZATMA
* TEK KANAL 2  /  DARBE UZATMA
* KANAL 1  -  DC BIAS / ESIK AYARI
* KANAL 2  -  DC BIAS / ESIK AYARI
* KANAL 1  -  GIRIS KORUMA
* KANAL 2  -  GIRIS KORUMA
* PMT1  -  VREF / KAZANC AYARI
* PMT2  -  VREF / KAZANC AYARI
* BESLEME  /  PMT ICIN 5V
* LOJIK VE ANALOG BESLEME  /  3.3V
* ENTEGRE YAKINI BESLEME KONDANSATORLERI
* RTH_TRIM1 ve RTH_TRIM2: gosterilen nominal ayar 50 ohm.
* Butun toprak sembolleri ortak GND dugumudur.
.include SUNUM_MODELLER.inc
* DUGUM REHBERI
* PMT1_SMA / PMT2_SMA : 50-ohm girisler
* INM1 / INM2 : TLV negatif girisleri
* TH1_OFF / TH2_OFF : esik girisleri
* U3A_OUT / U3B_OUT : TLV cikislari
* CH1_N1 / CH2_N1 : 33R sonrasi
* CH1_PS / CH2_PS : ilk Schmitt cikislari
* COINC_FAST : AND cikisi
* STM_SING1 / STM_SING2 : tek kanal
* STM_COINC : coincidence sayim girisi
* ENTEGRELER
* 2 x TLV3601
* 3 x SN74LVC2G17  (6 Schmitt kapisi)
* 1 x SN74LVC1G08
* CABLE / CIN / PAR ve STM yuk elemanlari
* simulasyonun parazit / giris-yuku esdegerleridir.
* REG bloklari onceki besleme esdegerleridir.
* PMT ve STM32 bu sayfada arayuzlerle gosterilir.
.backanno
.end